# Altium schematic sheet Output-Connection-Sheet.SchDoc
size A4; SheetNumber: 5; SheetTotal: 9
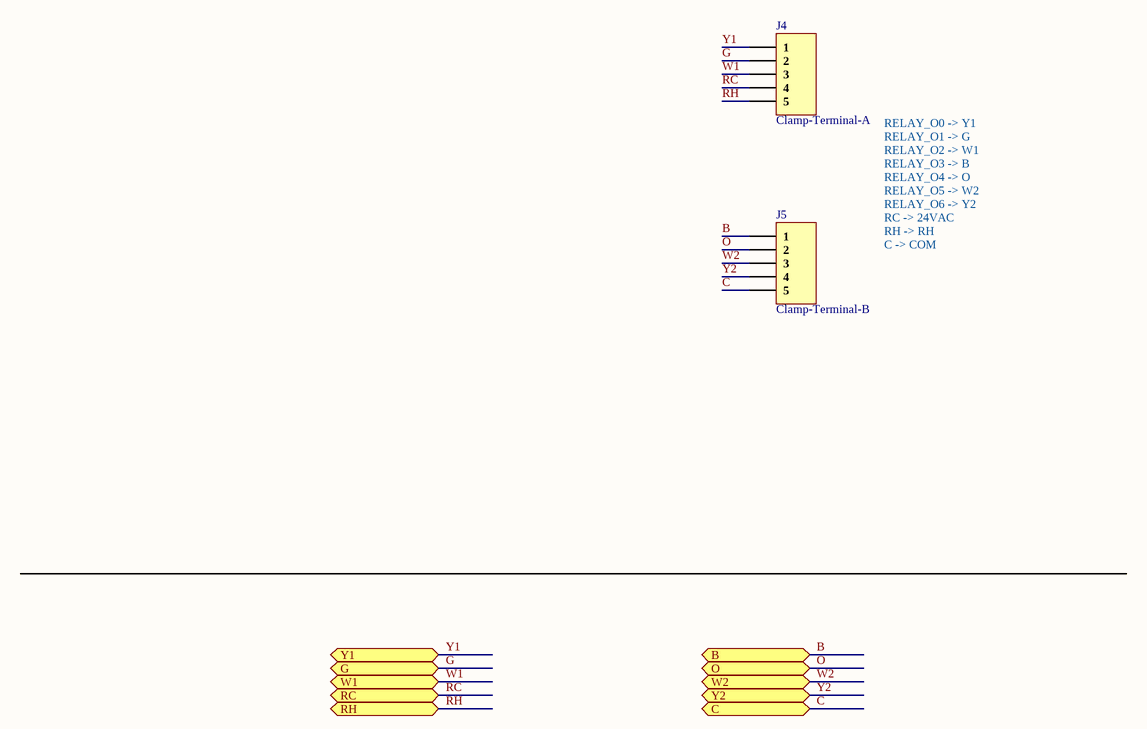
[diagram p0: Output-Connection-Sheet.SchDoc]

## Parts
J4  Clamp-Terminal-A  [Clamp-Terminal-A]
J5  Clamp-Terminal-B  [Clamp-Terminal-B.]

## Ports
B (bidir), C (bidir), G (bidir), O (bidir), RC (bidir), RH (bidir), W1 (bidir), W2 (bidir), Y1 (bidir), Y2 (bidir)

## Nets
B: J5.1 ; port B
C: J5.5 ; port C
G: J4.2 ; port G
O: J5.2 ; port O
RC: J4.4 ; port RC
RH: J4.5 ; port RH
W1: J4.3 ; port W1
W2: J5.3 ; port W2
Y1: J4.1 ; port Y1
Y2: J5.4 ; port Y2

## Notes on the sheet
- RELAY_O0 -> Y1
  RELAY_O1 -> G
  RELAY_O2 -> W1
  RELAY_O3 -> B
  RELAY_O4 -> O
  RELAY_O5 -> W2
  RELAY_O6 -> Y2
  RC -> 24VAC
  RH -> RH
  C -> COM
- File:
- Title:
- Date:
- Page
- Num:
- Total:
- Drawn By: Huzaifa Ali

## Library data of the parts
J4 = Clamp-Terminal-A: PinHeader_1x05_P5.00mm_Vertical
J5 = Clamp-Terminal-B: PinHeader_1x05_P5.00mm_Vertical